# Altium project IMU_Shield.PrjPcb
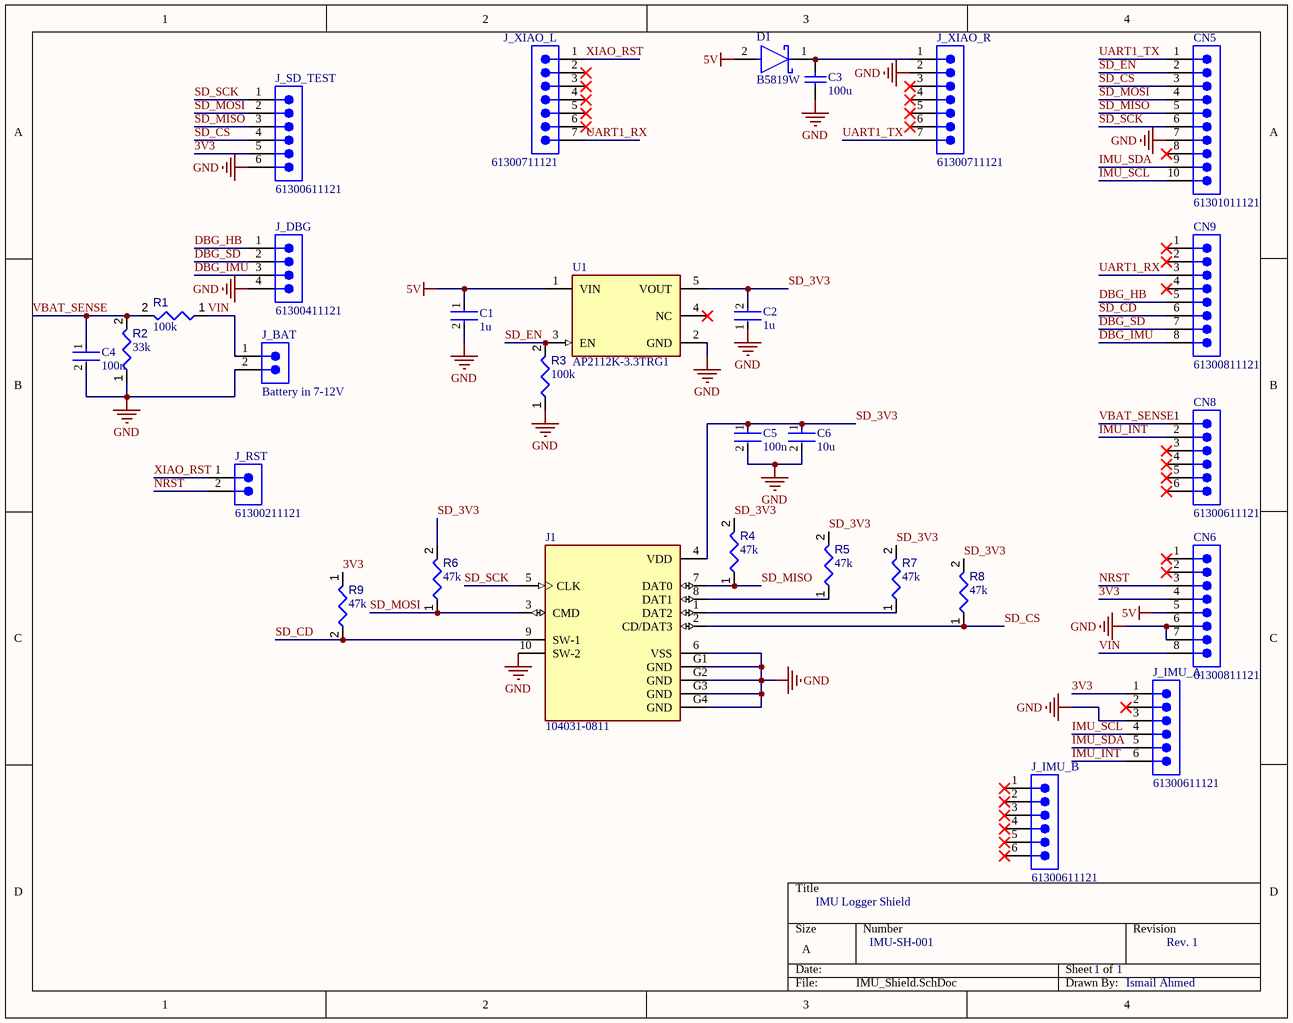
[diagram p0: IMU_Shield.SchDoc]
1 sheet, 30 parts. Net scope: global (net labels, ports and power ports of the same name join across sheets).
Board file: IMU_Shield.PcbDoc

## Sheet IMU_Shield.SchDoc
size A; SheetNumber: 1; SheetTotal: 1

### Parts
C1  1u  [FP-C0603-CJ-MFG]
C2  1u  [FP-C0603-CJ-MFG]
C3  100u  [CAPC3216X190X55ML30T25]
C4  100n  [FP-CC0603-DA-MFG]
C5  100n  [FP-CC0603-DA-MFG]
C6  10u  [FP-CL21-IPC_A]
CN5  61301011121  [61301011121]
CN6  61300811121  [61300811121]
CN8  61300611121  [61300611121]
CN9  61300811121  [61300811121]
D1  B5819W  [FP-SOD123-IPC_A]
J1  104031-0811  [MOLEX_104031-0811]
J_BAT  Battery in 7-12V  [61300211121]
J_DBG  61300411121  [61300411121]
J_IMU_A  61300611121  [61300611121]
J_IMU_B  61300611121  [61300611121]
J_RST  61300211121  [61300211121]
J_SD_TEST  61300611121  [61300611121]
J_XIAO_L  61300711121  [61300711121]
J_XIAO_R  61300711121  [61300711121]
R1  value 100k  [RESC1608X55X25ML10T15]  (hidden comment: Resistor 100k +/-1% 0603 100 mW)
R2  33k  [RESC1608X55X25ML10T15]
R3  value 100k  [RESC1608X55X25ML10T15]  (hidden comment: Resistor 100k +/-1% 0603 100 mW)
R4  47k  [RESC1608X55X25ML10T15]
R5  47k  [RESC1608X55X25ML10T15]
R6  47k  [RESC1608X55X25ML10T15]
R7  47k  [RESC1608X55X25ML10T15]
R8  47k  [RESC1608X55X25ML10T15]
R9  47k  [RESC1608X55X25ML10T15]
U1  AP2112K-3.3TRG1  [FP-SOT25-IPC_A]

### Nets
5V: C1.1 CN6.5 D1.2(A) U1.1(VIN)
GND: C1.2 C2.1 C3.2 C4.2 C5.2 C6.2 CN5.7 CN6.6 CN6.7 J1.6(VSS) J1.10(SW-2) J1.G1(GND) J1.G2(GND) J1.G3(GND) J1.G4(GND) J_BAT.2 J_DBG.4 J_IMU_A.3 J_SD_TEST.6 J_XIAO_R.2 R2.1 R3.1 U1.2(GND)
3V3: CN6.4 J_IMU_A.1 J_SD_TEST.5 R9.1
DBG_HB: CN9.5 J_DBG.1
DBG_IMU: CN9.8 J_DBG.3
DBG_SD: CN9.7 J_DBG.2
IMU_INT: CN8.2 J_IMU_A.6
IMU_SCL: CN5.10 J_IMU_A.4
IMU_SDA: CN5.9 J_IMU_A.5
NRST: CN6.3 J_RST.2
SD_3V3: C2.2 C5.1 C6.1 J1.4(VDD) R4.2 R5.2 R6.2 R7.2 R8.2 U1.5(VOUT)
SD_CD: CN9.6 J1.9(SW-1) R9.2
SD_CS: CN5.3 J1.2(CD/DAT3) J_SD_TEST.4 R8.1
SD_EN: CN5.2 R3.2 U1.3(EN)
SD_MISO: CN5.5 J1.7(DAT0) J_SD_TEST.3 R4.1
SD_MOSI: CN5.4 J1.3(CMD) J_SD_TEST.2 R6.1
SD_SCK: CN5.6 J1.5(CLK) J_SD_TEST.1
UART1_RX: CN9.3 J_XIAO_L.7
UART1_TX: CN5.1 J_XIAO_R.7
VBAT_SENSE: C4.1 CN8.1 R1.2 R2.2
VIN: CN6.8 J_BAT.1 R1.1
XIAO_RST: J_RST.1 J_XIAO_L.1
NetC3_1: C3.1 D1.1(C) J_XIAO_R.1
NetJ1_1: J1.1(DAT2) R7.1
NetJ1_8: J1.8(DAT1) R5.1

Not connected (* = marked no-connect by the designer): CN5 8*; CN6 1* 2*; CN8 3* 4* 5* 6*; CN9 1* 2* 4*; J_IMU_A 2*; J_IMU_B 1* 2* 3* 4* 5* 6*; J_XIAO_L 2* 3* 4* 5* 6*; J_XIAO_R 3* 4* 5* 6*; U1 4(NC)*

### Notes on the sheet
- IMU Logger Shield
- IMU-SH-001
- 1
- Rev. 1
- Ismail Ahmed

### Library data of the parts
C1 = CMP-03020-024138-1: CAP CER 0603 1UF 10V X7R 10%; Manufacturer: KEMET; Manufacturer Part Number: C0603C105K8RACAUTO; Temperature Coefficient: 15%; Automotive Grade: Grade 1; Material: Ceramic; Name: C15849; Device Class L3: Ceramic Capacitors; Octopart: https://octopart.com/c0603c105k8racauto-kemet-91328492; Capacitance: 1uF; Voltage Rating: 10V; Device Class L2: Capacitors; Lead Free: Yes; Device Class L1: Passive Components; ComponentLink2URL: https://content.kemet.com/datasheets/KEM_C1023_X7R_AUTO_SMD.pdf; Temperature Characteristic: X7R; Temperature Range Low: -55°C; Temperature Range High: +125°C; Category: Cap; Ipc Land Pattern Name: CAPC16080X80; Tolerance: 10%; Package: C0603-CJ; ComponentLink2Description: Datasheet; Temperature: -55°C to +125°C; RoHS: TRUE; Value: 1uF; Height: 0.95mm; Automotive: Yes; Digikey Description: CAP CER 0603 1UF 10V X7R 10%; LCSC: C15849
C2 = CMP-03020-024138-1: CAP CER 0603 1UF 10V X7R 10%; Manufacturer: KEMET; Manufacturer Part Number: C0603C105K8RACAUTO; Temperature Coefficient: 15%; Automotive Grade: Grade 1; Material: Ceramic; Device Class L3: Ceramic Capacitors; Octopart: https://octopart.com/c0603c105k8racauto-kemet-91328492; Capacitance: 1uF; Voltage Rating: 10V; Device Class L2: Capacitors; Lead Free: Yes; Device Class L1: Passive Components; ComponentLink2URL: https://content.kemet.com/datasheets/KEM_C1023_X7R_AUTO_SMD.pdf; Temperature Characteristic: X7R; Temperature Range Low: -55°C; Temperature Range High: +125°C; Category: Cap; Ipc Land Pattern Name: CAPC16080X80; Tolerance: 10%; Package: C0603-CJ; ComponentLink2Description: Datasheet; Temperature: -55°C to +125°C; RoHS: TRUE; Value: 1uF; Height: 0.95mm; Automotive: Yes; Digikey Description: CAP CER 0603 1UF 10V X7R 10%; LCSC: C15849
C3 = CMP-1662-00011-2: Chip Capacitor, 100 uF, +/- 20%, 6.3 V, -55 to 85 degC, 1206 (3216 Metric), RoHS, Tape and Reel; PartNumber: GRM31CR60J107ME39L; Case\/Package: 1206; Capacitance: 100 uF; Voltage Rating (DC): 6.3 V; Type (Capacitors): X5R; REACH SVHC: No SVHC; Height: 1.6 mm; Tolerance: 20%; Packaging: Tape and Reel; Mount: Surface Mount; PackageDescription: 2-Pin Surface Mount Device, Body 3.2 x 1.6 mm; ComponentLink1URL: http://www.murata.com/; Pins: 2; ComponentLink2Description: Datasheet; PackageReference: 1206; Width: 1.6 mm; Package Quantity: 2000; Min Operating Temperature: -55 degC; Case Code (Imperial): 1206; Max Operating Temperature: 85 degC; DatasheetVersion: 09/2016; Mounting Technology: Surface Mount; Voltage Rating: 6.3 V; ComponentLink1Description: Manufacturer URL; Radiation Hardening: No; Case Code (Metric): 3216; Length: 3.2 mm; ComponentLink2URL: http://psearch.en.murata.com/capacitor/product/GRM31CR60J107ME39%23.pdf; RoHSCompliant: true; LCSC: C15008
C4 C5 = CMP-2100-03601-2: CAP CER 0.1UF 50V X7R 0603; Manufacturer: YAGEO; Manufacturer Part Number: CC0603KRX7R9BB104; Material: Ceramic; Capacitance: 100 nF; Temperature Coefficient: 15%; Tolerance: 0.1; Value: 100 nF; Height: 0.9mm; Voltage: 50 V; ComponentLink2Description: Datasheet; Device Class L2: Capacitors; Temperature Range High: +125°C; Category: Cap; Footprint Url: http://www.yageo.com/exep/pages/download/literatures/UPY-C_GEN_24.pdf; ComponentLink2URL: http://www.yageo.com/documents/recent/UPY-GPHC_X7R_6.3V-to-50V_18.pdf; Package: CC0603-DA; Temperature: -55°C to +125°C; Voltage Rating: 50 V; Temperature Characteristic: X7R; Device Class L1: Passive Components; Temperature Range Low: -55°C; RoHS: TRUE; Automotive: No; Device Class L3: Ceramic Capacitors; Octopart: https://octopart.com/cc0603krx7r9bb104-yageo-42244635; Mouser Description: Multilayer Ceramic Capacitor, CC Series, 0.1 - F, - 10%, X7R, 50 V, 0603 [1608 Metric]; Lead Free: Yes; Digikey Description: CAP CER 0.1UF 50V X7R 0603; LCSC: C14663
C6 = CMP-13271-002975-1: CL21 Series 0805 10uF 25V ±10% Tolerance X5R Multilayer Ceramic Chip Capacitor; Case Code (Imperial): 0805; Length: 2mm; Case/Package: 0805; Packaging: Tape and Reel; Width: 0.049inch; Tolerance: 10%; Mount: Surface Mount; Min Operating Temperature: -55°C; Thickness: 0.057inch; Height: 1.25mm; Dielectric: X5R; Package Quantity: 1; Depth: 1.25mm; Capacitance: 10uF; Voltage Rating: 25V; Case Code (Metric): 2012; Max Operating Temperature: 85°C; Radiation Hardening: No; LCSC: C15850
CN5 = CMP-1502-01082-6: THT Vertical Pin Header WR-PHD, Pitch 2.54 mm, Single Row, 10 pins; Gender: Male; Voltage Rating: 250V; Connector Type: Male Pin; Current Rating: 3A; Number of Contacts: 10; Pitch: 2.54mm; Contact Resistance: 20mΩ; Insulation Resistance: 1GΩ; RoHS: Compliant; Length: 2.54mm; Max Operating Temperature: 105°C; Flammability Rating: UL94 V-0; Width: 25.4mm; Number of Positions: 10; Number of Rows: 1; Lead Pitch: 2.54mm; Number of Pins: 10; Termination: Solder; Operating Supply Voltage: 250V; Color: Black; Housing Material: PBT; Orientation: Vertical; Packaging: Bulk; Mount: Through Hole; Contact Mating Length: 5.9944mm; Contact Material: Gold; Height: 8.74mm; Min Operating Temperature: -40°C; Contact Plating: Gold; Contact Gender: Male
CN6 CN9 = CMP-1502-01076-4: THT Vertical Pin Header WR-PHD, Pitch 2.54 mm, Single Row, 8 pins; Pitch: 2.54mm; Voltage Rating: 250V; Connector Type: Male Pin; Current Rating: 3A; Contact Resistance: 20mΩ; Number of Positions: 8; Gender: Male; Contact Mating Length: 5.9944mm; Orientation: Vertical; Contact Plating: Gold; Mount: Through Hole; Min Operating Temperature: -40°C; Packaging: Bulk; Height: 8.54mm; Number of Pins: 8; Contact Material: Gold; Operating Supply Voltage: 250V; Termination: Solder; RoHS: Compliant; Color: Black; Number of Contacts: 8; Lead Pitch: 2.54mm; Number of Rows: 1; Max Operating Temperature: 105°C
CN8 J_IMU_A J_IMU_B J_SD_TEST = CMP-1502-01070-4: THT Vertical Pin Header WR-PHD, Pitch 2.54 mm, Single Row, 6 pins; Pitch: 2.54mm; Operating Supply Voltage: 250V; Connector Type: Male Pin; Gender: Male; Number of Positions: 6; Contact Resistance: 20mΩ; Current Rating: 3A; Termination: Through Hole; Color: Black; Number of Pins: 6; Lead Pitch: 2.54mm; Height: 8.89mm; RoHS: Compliant; Lead Free: Lead Free; Contact Mating Length: 5.9944mm; Contact Plating: Gold; Contact Gender: Male; Packaging: Bulk; Orientation: Vertical; Mount: Through Hole; Voltage Rating: 250V; Number of Rows: 1; Max Operating Temperature: 105°C; Min Operating Temperature: -40°C; Housing Material: PBT; Contact Material: Gold; Number of Contacts: 6
D1 = CMP-0303-00003-3: DIODE SCHOTTKY 40V 1A SOD123; Forward Voltage: 450mV; Capacitance: 110pF; Max Forward Surge Current (Ifsm): 25A; Peak Reverse Current: 50uA; Polarity: Standard; Element Configuration: Single; Max Power Dissipation: 450mW; Min Operating Temperature: -65°C; Package Quantity: 3000; Contact Plating: Tin; Weight: 0.000353oz; Max Repetitive Reverse Voltage (Vrrm): 40V; Max Reverse Voltage (DC): 40V; Height: 1.25mm; Average Rectified Current: 1A; Width: 1.7mm; Case/Package: SOD-123-2; Lead Free: Lead Free; Max Operating Temperature: 125°C; Current Rating: 1A; Termination: SMD/SMT; Forward Current: 1A; Radiation Hardening: No; Number of Pins: 2; Length: 2.85mm; Voltage Rating (DC): 40V; REACH SVHC: No SVHC; Peak Non-Repetitive Surge Current: 25A; Packaging: Tape and Reel; Output Current: 1A; LCSC: C8598
J1 = CMP-003-000000-1: Surface Mount Micro SD Card Connector, with Push In Termination; MF: Molex; Design Item ID: 104031-0811; Pin Count: 14; SnapEDA_Link: https://www.snapeda.com/parts/104031-0811/Molex/view-part/?ref=snap; LCSC: C585350; Check_prices: https://www.snapeda.com/parts/104031-0811/Molex/view-part/?ref=eda; MP: 104031-0811; Package: None; Source: 104031-0811.SchLib; Component Type: Standard
J_BAT J_RST = CMP-1712-00002-7: THT Vertical Pin Header WR-PHD, Pitch 2.54 mm, Single Row, 2 pins; Pitch: 2.54mm; Number of Contacts: 2; Connector Type: Male Pin; Gender: Male; Contact Resistance: 20mΩ; Operating Supply Voltage: 250V; Current Rating: 3A; Housing Material: PBT; RoHS: Compliant; Lead Free: Lead Free; Contact Material: Gold; REACH SVHC: No; Min Operating Temperature: -40°C; Termination: Through Hole; Number of Pins: 2; Contact Gender: Male; Packaging: Bulk; Lead Pitch: 2.54mm; Contact Plating: Gold; Orientation: Vertical; Mount: Through Hole; Height: 8.94mm; Color: Black; Number of Positions: 2; Contact Mating Length: 5.9944mm; Max Operating Temperature: 105°C; Voltage Rating: 250V; Number of Rows: 1
J_DBG = CMP-1502-01064-4: THT Vertical Pin Header WR-PHD, Pitch 2.54 mm, Single Row, 4 pins; Connector Type: Male Pin; Gender: Male; Current Rating: 3A; Number of Positions: 4; Operating Supply Voltage: 250V; Contact Resistance: 20mΩ; Pitch: 2.54mm; Max Operating Temperature: 105°C; Mount: Through Hole; Contact Material: Gold; Contact Plating: Gold; Number of Contacts: 4; Orientation: Vertical; Packaging: Bulk; Contact Mating Length: 5.9944mm; Voltage Rating: 250V; Number of Rows: 1; Height: 8.89mm; Lead Free: Lead Free; Lead Pitch: 2.54mm; Number of Pins: 4; Color: Black; Min Operating Temperature: -40°C; RoHS: Compliant; Termination: Solder
J_XIAO_L J_XIAO_R = CMP-1502-01074-4: THT Vertical Pin Header WR-PHD, Pitch 2.54 mm, Single Row, 7 pins; Number of Positions: 7; Pitch: 2.54mm; Gender: Male; Operating Supply Voltage: 250V; Contact Resistance: 20mΩ; Current Rating: 3A; Connector Type: Male Pin; Contact Mating Length: 5.9944mm; Number of Rows: 1; Packaging: Bulk; Contact Material: Copper; Orientation: Vertical; Color: Black; Mount: Through Hole; Termination: Solder; RoHS: Compliant; Lead Pitch: 2.54mm; Contact Plating: Gold; Number of Pins: 7; Number of Contacts: 7
R1 R3 = CMP-009-00023-5: Chip Resistor, 100 KOhm, +/- 1%, 0.1 W, -55 to 155 degC, 0603 (1608 Metric); Voltage Rating: 50V; Power: 100mW; Max Operating Temperature: 155°C; RoHS Compliant: True; Tolerance: 1%; Pins: 2; Case/Package: 0603; Mounting Technology: SM; Min Operating Temperature: -55°C; LCSC: C25803
R2 = CMP-009-00023-5: Chip Resistor, 33 KOhm, +/- 1%, 0.1 W, -55 to 155 degC, 0603 (1608 Metric); Voltage Rating: 50V; Power: 100mW; Max Operating Temperature: 155°C; Value: 33k; RoHS Compliant: True; Tolerance: 1%; Pins: 2; Case/Package: 0603; Mounting Technology: SM; Min Operating Temperature: -55°C; LCSC: C4216
R4-R9 = CMP-009-00023-5: Chip Resistor, 47 KOhm, +/- 1%, 0.1 W, -55 to 155 degC, 0603 (1608 Metric); Voltage Rating: 50V; Power: 100mW; Max Operating Temperature: 155°C; Value: 47k; RoHS Compliant: True; Tolerance: 1%; Pins: 2; Case/Package: 0603; Mounting Technology: SM; Min Operating Temperature: -55°C; LCSC: C25819
U1 = CMP-12756-000035-1: IC REG LINEAR 3.3V 600MA SOT25; Number of Regulators: 1; Output Type: Fixed; Polarity: Positive; Min Input Voltage: 2.5V; Max Input Voltage: 6V; Accuracy: 1.5%; Quiescent Current: 55uA; Dropout Voltage: 250mV; Min Operating Temperature: -40°C; Length: 3.1mm; Output Current: 600mA; Max Operating Temperature: 85°C; Package Quantity: 1; Output Voltage: 3.3V; Width: 1.7mm; Number of Outputs: 1; Packaging: Tape and Reel; Height: 1.3mm; Lead Free: Lead Free; Max Output Current: 600mA; Case/Package: SOT-23-5; Mount: Surface Mount; Number of Pins: 5; LCSC: C51118